# Altium schematic sheet 00_Modulos.SchDoc: Modulo de Control Secundario - Diagrama de modulos
size A; SheetNumber: 1; SheetTotal: 5
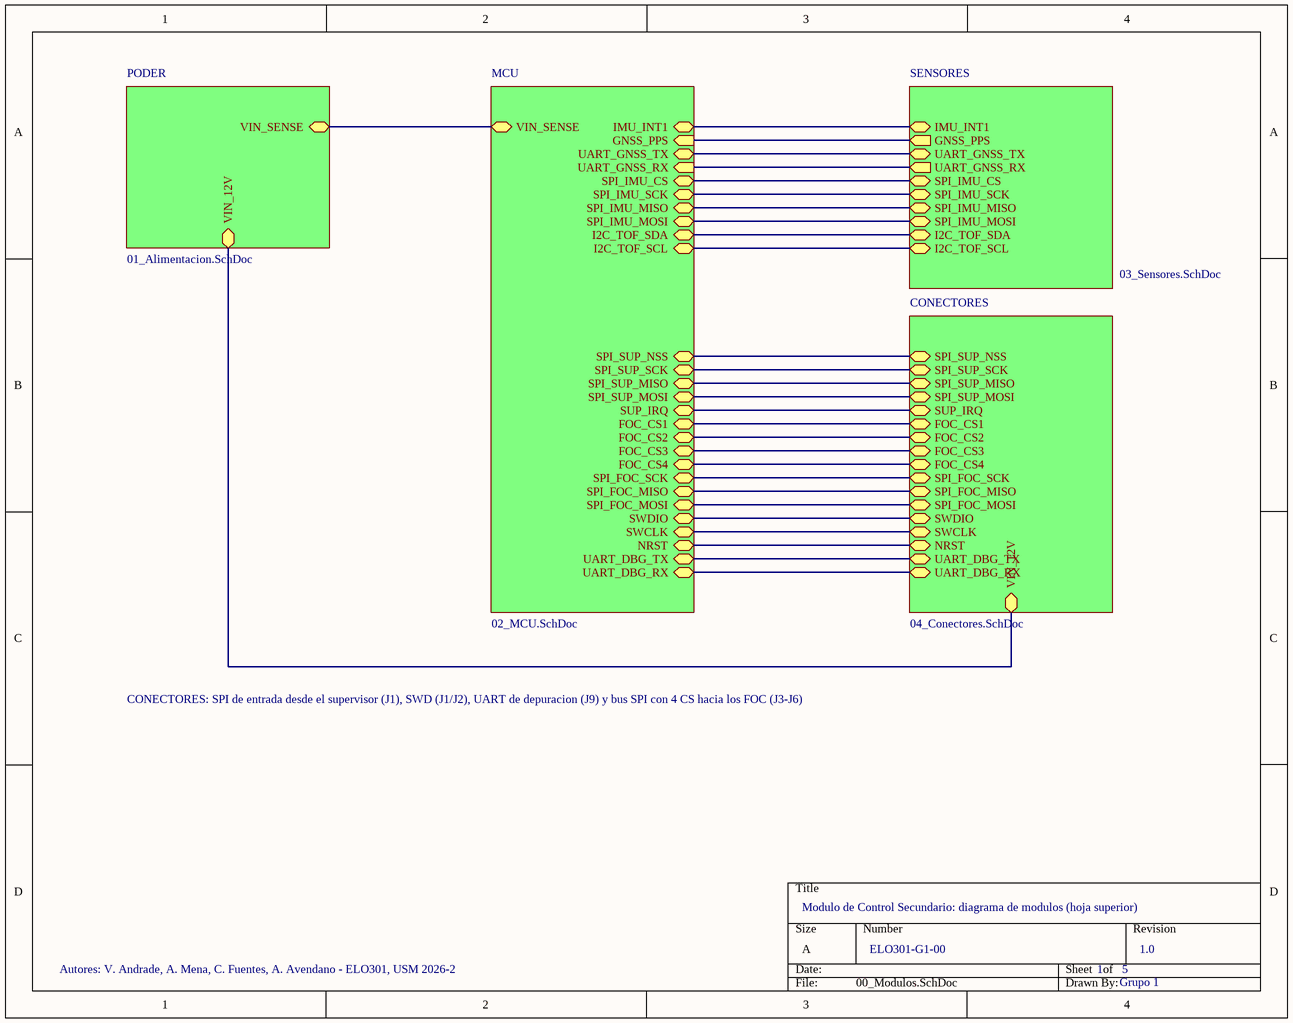
[diagram p0: 00_Modulos.SchDoc]

## Sub-sheets
CONECTORES = 04_Conectores.SchDoc: SPI_SUP_NSS (bidir), SPI_SUP_SCK (bidir), SPI_SUP_MISO (bidir), SPI_SUP_MOSI (bidir), SUP_IRQ (bidir), FOC_CS1 (bidir), FOC_CS2 (bidir), FOC_CS3 (bidir), FOC_CS4 (bidir), SPI_FOC_SCK (bidir), SPI_FOC_MISO (bidir), SPI_FOC_MOSI (bidir), SWDIO (bidir), SWCLK (bidir), NRST (bidir), UART_DBG_TX (bidir), UART_DBG_RX (bidir), VIN_12V (bidir)
MCU = 02_MCU.SchDoc: VIN_SENSE (bidir), IMU_INT1 (bidir), GNSS_PPS (in), UART_GNSS_TX (bidir), UART_GNSS_RX (in), SPI_IMU_CS (bidir), SPI_IMU_SCK (bidir), SPI_IMU_MISO (bidir), SPI_IMU_MOSI (bidir), I2C_TOF_SDA (bidir), I2C_TOF_SCL (bidir), SPI_SUP_NSS (bidir), SPI_SUP_SCK (bidir), SPI_SUP_MISO (bidir), SPI_SUP_MOSI (bidir), SUP_IRQ (bidir), FOC_CS1 (bidir), FOC_CS2 (bidir), FOC_CS3 (bidir), FOC_CS4 (bidir), SPI_FOC_SCK (bidir), SPI_FOC_MISO (bidir), SPI_FOC_MOSI (bidir), SWDIO (bidir), SWCLK (bidir), NRST (bidir), UART_DBG_TX (bidir), UART_DBG_RX (bidir)
PODER = 01_Alimentacion.SchDoc: VIN_SENSE (bidir), VIN_12V (bidir)
SENSORES = 03_Sensores.SchDoc: IMU_INT1 (bidir), GNSS_PPS (out), UART_GNSS_TX (bidir), UART_GNSS_RX (out), SPI_IMU_CS (bidir), SPI_IMU_SCK (bidir), SPI_IMU_MISO (bidir), SPI_IMU_MOSI (bidir), I2C_TOF_SDA (bidir), I2C_TOF_SCL (bidir)

## Nets
(unnamed): sheet PODER/VIN_SENSE, sheet MCU/VIN_SENSE
(unnamed): sheet PODER/VIN_12V, sheet CONECTORES/VIN_12V
(unnamed): sheet MCU/IMU_INT1, sheet SENSORES/IMU_INT1
(unnamed): sheet MCU/GNSS_PPS, sheet SENSORES/GNSS_PPS
(unnamed): sheet MCU/UART_GNSS_TX, sheet SENSORES/UART_GNSS_TX
(unnamed): sheet MCU/UART_GNSS_RX, sheet SENSORES/UART_GNSS_RX
(unnamed): sheet MCU/SPI_IMU_CS, sheet SENSORES/SPI_IMU_CS
(unnamed): sheet MCU/SPI_IMU_SCK, sheet SENSORES/SPI_IMU_SCK
(unnamed): sheet MCU/SPI_IMU_MISO, sheet SENSORES/SPI_IMU_MISO
(unnamed): sheet MCU/SPI_IMU_MOSI, sheet SENSORES/SPI_IMU_MOSI
(unnamed): sheet MCU/I2C_TOF_SDA, sheet SENSORES/I2C_TOF_SDA
(unnamed): sheet MCU/I2C_TOF_SCL, sheet SENSORES/I2C_TOF_SCL
(unnamed): sheet MCU/SPI_SUP_NSS, sheet CONECTORES/SPI_SUP_NSS
(unnamed): sheet MCU/SPI_SUP_SCK, sheet CONECTORES/SPI_SUP_SCK
(unnamed): sheet MCU/SPI_SUP_MISO, sheet CONECTORES/SPI_SUP_MISO
(unnamed): sheet MCU/SPI_SUP_MOSI, sheet CONECTORES/SPI_SUP_MOSI
(unnamed): sheet MCU/SUP_IRQ, sheet CONECTORES/SUP_IRQ
(unnamed): sheet MCU/FOC_CS1, sheet CONECTORES/FOC_CS1
(unnamed): sheet MCU/FOC_CS2, sheet CONECTORES/FOC_CS2
(unnamed): sheet MCU/FOC_CS3, sheet CONECTORES/FOC_CS3
(unnamed): sheet MCU/FOC_CS4, sheet CONECTORES/FOC_CS4
(unnamed): sheet MCU/SPI_FOC_SCK, sheet CONECTORES/SPI_FOC_SCK
(unnamed): sheet MCU/SPI_FOC_MISO, sheet CONECTORES/SPI_FOC_MISO
(unnamed): sheet MCU/SPI_FOC_MOSI, sheet CONECTORES/SPI_FOC_MOSI
(unnamed): sheet MCU/SWDIO, sheet CONECTORES/SWDIO
(unnamed): sheet MCU/SWCLK, sheet CONECTORES/SWCLK
(unnamed): sheet MCU/NRST, sheet CONECTORES/NRST
(unnamed): sheet MCU/UART_DBG_TX, sheet CONECTORES/UART_DBG_TX
(unnamed): sheet MCU/UART_DBG_RX, sheet CONECTORES/UART_DBG_RX

## Notes on the sheet
- CONECTORES: SPI de entrada desde el supervisor (J1), SWD (J1/J2), UART de depuracion (J9) y bus SPI con 4 CS hacia los FOC (J3-J6)
- Modulo de Control Secundario: diagrama de modulos (hoja superior)
- Autores: V. Andrade, A. Mena, C. Fuentes, A. Avendano - ELO301, USM 2026-2
- ELO301-G1-00
- 1
- 5
- 1.0
- Grupo 1